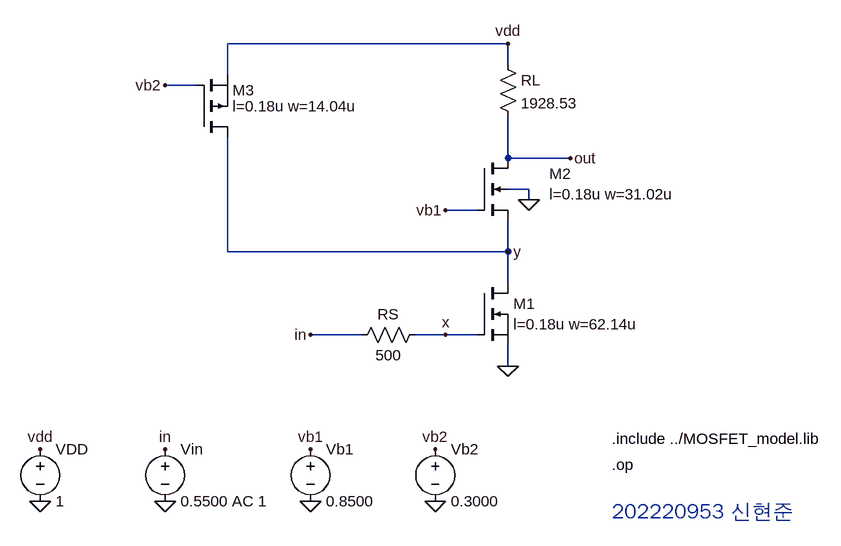
[diagram p0: schematic cascode.asc]
cascode.asc, the LTspice schematic file:
Version 4
SHEET 1 1400 960
WIRE 448 96 880 96
FLAG 880 96 vdd
SYMBOL pmos 400 240 M180
WINDOW 3 0 0 Invisible 2
WINDOW 0 56 72 Left 2
WINDOW 123 56 48 Left 2
SYMATTR InstName M3
SYMATTR Value CMOSP
SYMATTR Value2 l=0.18u w=14.04u
SYMATTR SpiceLine ad=6.88p as=6.88p pd=14.04u ps=14.04u
WIRE 448 96 448 144
WIRE 400 160 352 160
FLAG 352 160 vb2
WIRE 448 240 448 416
WIRE 448 416 880 416
DATAFLAG 320 320 "Id(M3)"
SYMBOL res 864 112 R0
SYMATTR InstName RL
SYMATTR Value 1928.53
WIRE 880 96 880 128
WIRE 880 208 880 272
WIRE 880 272 976 272
FLAG 976 272 out
SYMBOL nmos4 832 272 R0
WINDOW 3 0 0 Invisible 2
WINDOW 0 112 24 Left 2
WINDOW 123 112 56 Left 2
SYMATTR InstName M2
SYMATTR Value CMOSN
SYMATTR Value2 l=0.18u w=31.02u
SYMATTR SpiceLine ad=15.2p as=15.2p pd=31.02u ps=31.02u
WIRE 832 352 784 352
FLAG 784 352 vb1
WIRE 880 320 912 320
WIRE 912 320 912 336
FLAG 912 336 0
DATAFLAG 1056 240 "V(out)"
DATAFLAG 1088 368 "Id(M2)"
WIRE 880 368 880 416
WIRE 880 416 880 464
FLAG 880 416 y
DATAFLAG 976 416 "V(y)"
SYMBOL nmos 832 464 R0
WINDOW 3 0 0 Invisible 2
WINDOW 123 56 64 Left 2
SYMATTR InstName M1
SYMATTR Value CMOSN
SYMATTR Value2 l=0.18u w=62.14u
SYMATTR SpiceLine ad=30.45p as=30.45p pd=62.14u ps=62.14u
WIRE 880 560 880 592
FLAG 880 592 0
SYMBOL res 752 528 R90
WINDOW 0 0 56 VBottom 2
WINDOW 3 32 56 VTop 2
SYMATTR InstName RS
SYMATTR Value 500
WIRE 736 544 832 544
FLAG 784 544 x
WIRE 656 544 576 544
FLAG 576 544 in
DATAFLAG 720 624 "V(x)"
DATAFLAG 1040 584 "Id(M1)"
SYMBOL voltage 160 704 R0
WINDOW 0 24 16 Left 2
WINDOW 3 24 96 Left 2
SYMATTR InstName VDD
SYMATTR Value 1
FLAG 160 720 vdd
FLAG 160 800 0
SYMBOL voltage 352 704 R0
WINDOW 0 24 16 Left 2
WINDOW 3 24 96 Left 2
SYMATTR InstName Vin
SYMATTR Value 0.5500 AC 1
FLAG 352 720 in
FLAG 352 800 0
SYMBOL voltage 576 704 R0
WINDOW 0 24 16 Left 2
WINDOW 3 24 96 Left 2
SYMATTR InstName Vb1
SYMATTR Value 0.8500
FLAG 576 720 vb1
FLAG 576 800 0
SYMBOL voltage 768 704 R0
WINDOW 0 24 16 Left 2
WINDOW 3 24 96 Left 2
SYMATTR InstName Vb2
SYMATTR Value 0.3000
FLAG 768 720 vb2
FLAG 768 800 0
TEXT 1040 704 Left 2 !.include ../MOSFET_model.lib
TEXT 1040 744 Left 2 !.op
TEXT 1040 816 Left 3 ;202220953 신현준

The netlist it stands for:
* cascode.asc
M3 y vb2 vdd vdd CMOSP l=0.18u w=14.04u ad=6.88p as=6.88p pd=14.04u ps=14.04u
RL vdd out 1928.53
M2 out vb1 y 0 CMOSN l=0.18u w=31.02u ad=15.2p as=15.2p pd=31.02u ps=31.02u
M1 y x 0 0 CMOSN l=0.18u w=62.14u ad=30.45p as=30.45p pd=62.14u ps=62.14u
RS x in 500
VDD vdd 0 1
Vin in 0 0.5500 AC 1
Vb1 vb1 0 0.8500
Vb2 vb2 0 0.3000
.model NMOS NMOS
.model PMOS PMOS
.lib standard.mos
.include ../MOSFET_model.lib
.op
* 202220953 신현준
.backanno
.end

* Results of the author's LTspice run, read from the files saved beside the schematic
* Operating Point:
*   V(in) = 550 mV
*   V(out) = 600.5 mV
*   V(vb1) = 850 mV
*   V(vb2) = 300 mV
*   V(vdd) = 1 V
*   V(x) = 550 mV
*   V(y) = 299.9 mV
*   I(RL) = 207.1 µA
*   I(RS) = 0 A
*   I(VDD) = -414.4 µA
*   I(Vb1) = 0 A
*   I(Vb2) = 0 A
*   I(Vin) = 0 A
*   Ib(M1) = -299.9 fA
*   Ib(M2) = -900.4 fA
*   Ib(M3) = 700.1 fA
*   Id(M1) = 414.4 µA
*   Id(M2) = 207.1 µA
*   Id(M3) = -207.3 µA
*   Ig(M1) = 0 A
*   Ig(M2) = 0 A
*   Ig(M3) = 0 A
*   Is(M1) = -414.4 µA
*   Is(M2) = -207.1 µA
*   Is(M3) = 207.3 µA